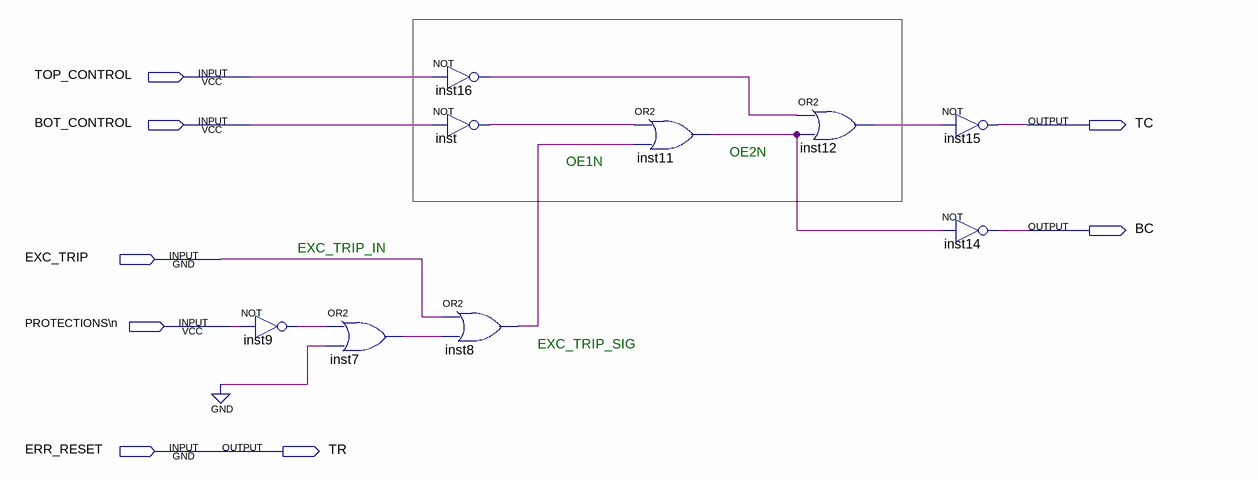
[diagram p0: schematic sheet]
// Quartus schematic generator_excitation_control.bdf as structural Verilog: 9 symbols, 8 pins
module generator_excitation_control (
  input  TOP_CONTROL,
  input  BOT_CONTROL,
  input  EXC_TRIP,
  input  \PROTECTIONS\n ,
  input  ERR_RESET,
  output TC,
  output BC,
  output TR
);

  wire inst7_out, inst8_out, inst9_out, inst11_out, inst12_out, inst16_out, inst_out;

  not inst9 (inst9_out, \PROTECTIONS\n );
  or inst7 (inst7_out, inst9_out, 1'b0);
  not inst16 (inst16_out, TOP_CONTROL);
  not inst (inst_out, BOT_CONTROL);
  or inst8 (inst8_out, EXC_TRIP, inst7_out);
  or inst11 (inst11_out, inst_out, inst8_out);
  or inst12 (inst12_out, inst16_out, inst11_out);
  not inst15 (TC, inst12_out);
  not inst14 (BC, inst11_out);

  assign TR = ERR_RESET;

  // Notes on the sheet:
  //   OE2N
  //   OE1N
  //   EXC_TRIP_IN
  //   EXC_TRIP_SIG
endmodule
